# Altium schematic sheet Controller-Sheet-2.SchDoc
size 420 x 297 mm; SheetNumber: 4; SheetTotal: 7
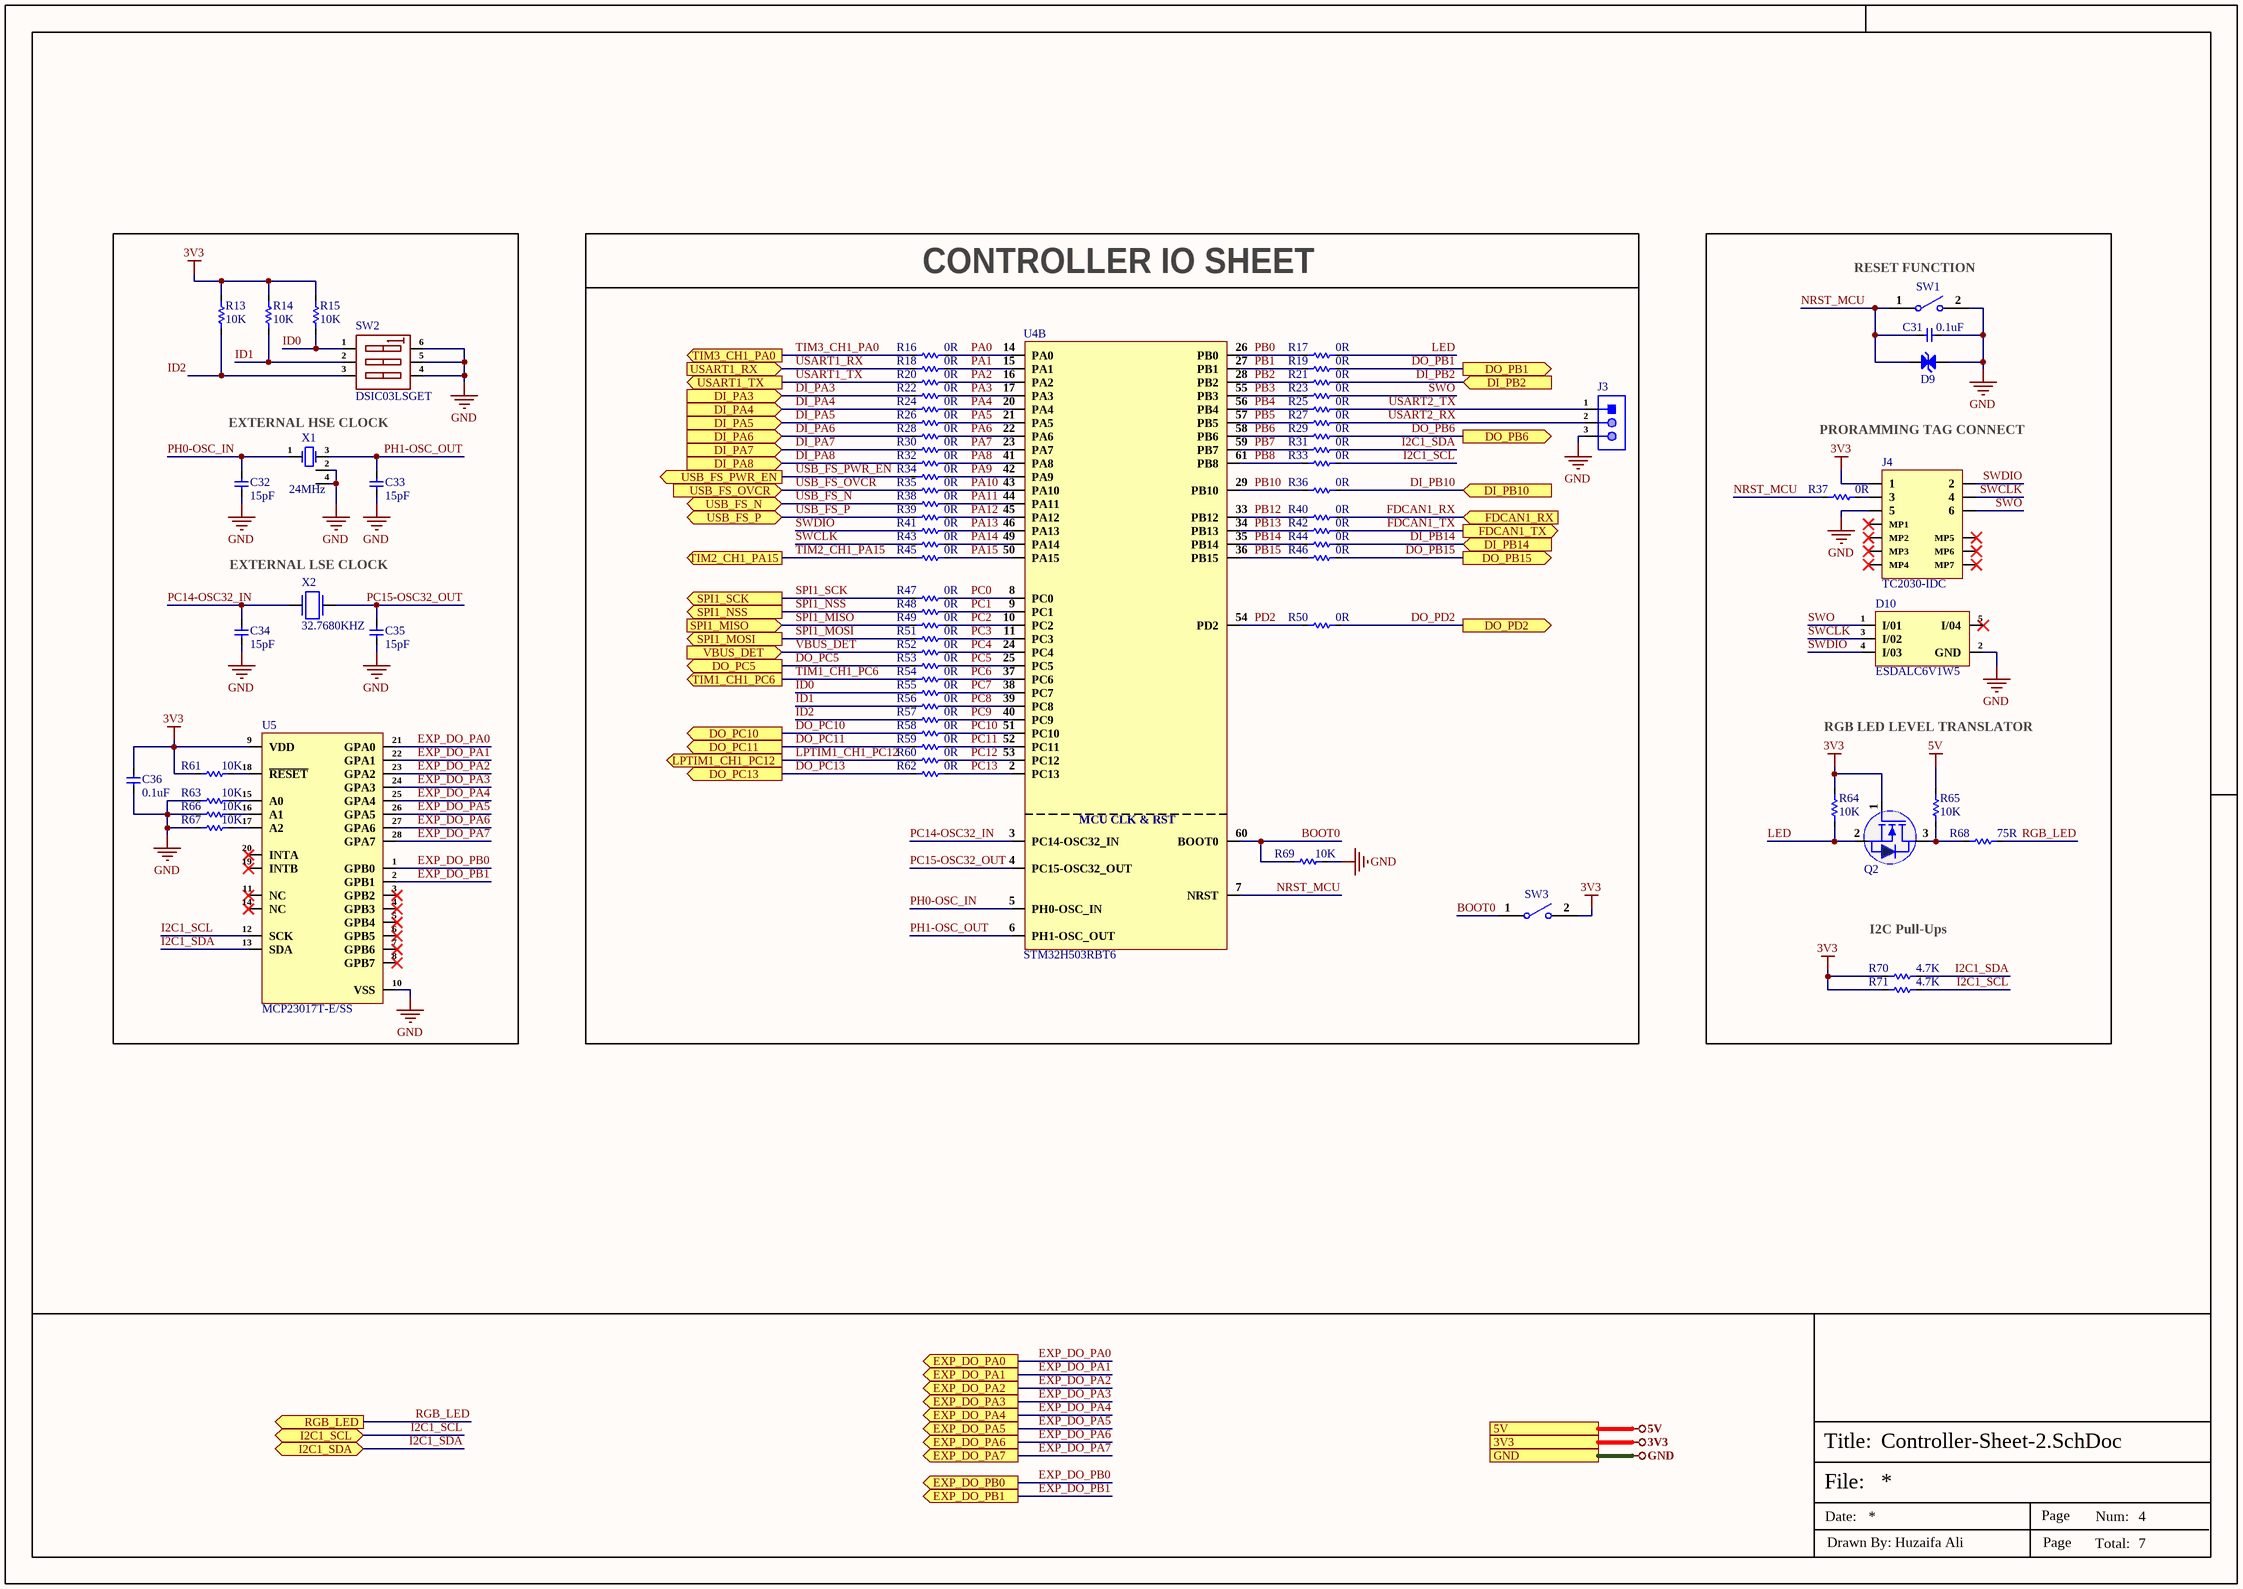
[diagram p0: Controller-Sheet-2.SchDoc]

## Parts
C31  0.1uF  [Cap-0402]
C32  15pF  [Cap-0201]
C33  15pF  [Cap-0201]
C34  15pF  [Cap-0201]
C35  15pF  [Cap-0201]
C36  0.1uF  [Cap-0402]
D9  ESDM2033MX4T5G  [DFN-2(0.3x0.6)]  (value not drawn)
D10  ESDALC6V1W5  [SOT-323-5]
J3  X6511WV-03H-C60D30  [HDR1X3_]  (value not drawn)
J4  TC2030-IDC  [TC2030-IDC_]
Q2  Si2302CDS  [Sot-23]  (value not drawn)
R13  10K  [Res-0402]
R14  10K  [Res-0402]
R15  10K  [Res-0402]
R16  0R  [Res-0402]
R17  0R  [Res-0402]
R18  0R  [Res-0402]
R19  0R  [Res-0402]
R20  0R  [Res-0402]
R21  0R  [Res-0402]
R22  0R  [Res-0402]
R23  0R  [Res-0402]
R24  0R  [Res-0402]
R25  0R  [Res-0402]
R26  0R  [Res-0402]
R27  0R  [Res-0402]
R28  0R  [Res-0402]
R29  0R  [Res-0402]
R30  0R  [Res-0402]
R31  0R  [Res-0402]
R32  0R  [Res-0402]
R33  0R  [Res-0402]
R34  0R  [Res-0402]
R35  0R  [Res-0402]
R36  0R  [Res-0402]
R37  0R  [Res-0402]
R38  0R  [Res-0402]
R39  0R  [Res-0402]
R40  0R  [Res-0402]
R41  0R  [Res-0402]
R42  0R  [Res-0402]
R43  0R  [Res-0402]
R44  0R  [Res-0402]
R45  0R  [Res-0402]
R46  0R  [Res-0402]
R47  0R  [Res-0402]
R48  0R  [Res-0402]
R49  0R  [Res-0402]
R50  0R  [Res-0402]
R51  0R  [Res-0402]
R52  0R  [Res-0402]
R53  0R  [Res-0402]
R54  0R  [Res-0402]
R55  0R  [Res-0402]
R56  0R  [Res-0402]
R57  0R  [Res-0402]
R58  0R  [Res-0402]
R59  0R  [Res-0402]
R60  0R  [Res-0402]
R61  10K  [Res-0402]
R62  0R  [Res-0402]
R63  10K  [Res-0402]
R64  10K  [Res-0402]
R65  10K  [Res-0402]
R66  10K  [Res-0402]
R67  10K  [Res-0402]
R68  75R  [Res-0402]
R69  10K  [Res-0402]
R70  4.7K  [Res-0402]
R71  4.7K  [Res-0402]
SW1  B3U-1000P  [B3U-1000P]  (value not drawn)
SW2  DSIC03LSGET  [DSIC03LSGET]
SW3  B3U-1000P  [B3U-1000P]  (value not drawn)
U4  STM32H503RBT6  [64-LQFP (10x10)]  (part B of 2)
U5  MCP23017T-E/SS  [SSOP-28-208mil]
X1  24MHz  [SMD2016-4P]
X2  32.7680KHZ  [NX3215SA-32.768K-STD-MUA-8_]

## Blocks framed on the sheet
CONTROLLER IO SHEET: J3 R16-R36 R38-R60 R62 R69 SW3 U4

## Ports
3V3 (see Top-Sheet[3B], Comms-Sheet[4D], Controller-Sheet-1[4D], Power-Sheet[4D], Stepper-Driver-Sheet[5D], USB-Sheet[4D]), 5V (see Top-Sheet[3B], Comms-Sheet[4D], Power-Sheet[4D], USB-Sheet[4D]), DI_PA3 (in, see Top-Sheet[3B]), DI_PA4 (in, see Top-Sheet[3B]), DI_PA5 (in, see Top-Sheet[3B]), DI_PA6 (in, see Top-Sheet[3B]), DI_PA7 (in, see Top-Sheet[3B]), DI_PA8 (in, see Top-Sheet[3B]), DI_PB2 (in, see Top-Sheet[3B]), DI_PB10 (in, see Top-Sheet[3B]), DI_PB14 (in, see Top-Sheet[3B]), DO_PB1 (out, see Top-Sheet[4B]), DO_PB6 (out, see Top-Sheet[3C]), DO_PB15 (out, see Top-Sheet[3C]), DO_PC5 (out, see Top-Sheet[3C]), DO_PC10 (out, see Top-Sheet[3B]), DO_PC11 (out, see Top-Sheet[3B]), DO_PC13 (out, see Top-Sheet[3B]), DO_PD2 (out, see Top-Sheet[3C]), EXP_DO_PA0 (out, see Top-Sheet[3C]), EXP_DO_PA1 (out, see Top-Sheet[3C]), EXP_DO_PA2 (out, see Top-Sheet[3C]), EXP_DO_PA3 (out, see Top-Sheet[3C]), EXP_DO_PA4 (out, see Top-Sheet[3C]), EXP_DO_PA5 (out, see Top-Sheet[3C]), EXP_DO_PA6 (out, see Top-Sheet[3C]), EXP_DO_PA7 (out, see Top-Sheet[3C]), EXP_DO_PB0 (out, see Top-Sheet[4B]), EXP_DO_PB1 (out, see Top-Sheet[4B]), FDCAN1_RX (in, see Top-Sheet[4B]), FDCAN1_TX (out, see Top-Sheet[4B]), GND (see Top-Sheet[3B], Comms-Sheet[4D], Controller-Sheet-1[4D], Power-Sheet[4D], Stepper-Driver-Sheet[5D], USB-Sheet[4D]), I2C1_SCL (bidir, see Top-Sheet[3B]), I2C1_SDA (bidir, see Top-Sheet[3B]), LPTIM1_CH1_PC12 (out, see Top-Sheet[3C]), RGB_LED (out, see Top-Sheet[4B]), SPI1_MISO (in, see Top-Sheet[3B]), SPI1_MOSI (out, see Top-Sheet[3B]), SPI1_NSS (out, see Top-Sheet[3B]), SPI1_SCK (out, see Top-Sheet[3B]), TIM1_CH1_PC6 (out, see Top-Sheet[3B]), TIM2_CH1_PA15 (out, see Top-Sheet[3B]), TIM3_CH1_PA0 (out, see Top-Sheet[3C]), USART1_RX (in, see Top-Sheet[4B]), USART1_TX (out, see Top-Sheet[4B]), USB_FS_N (bidir, see Top-Sheet[4B], USB-Sheet[5B]), USB_FS_OVCR (in, see Top-Sheet[4B], USB-Sheet[1D]), USB_FS_P (bidir, see Top-Sheet[4B], USB-Sheet[5B]), USB_FS_PWR_EN (out, see Top-Sheet[4B], USB-Sheet[1D]), VBUS_DET (in, see Top-Sheet[4B], USB-Sheet[4B])

## Nets
3V3: C36.1 J4.1 Q2.1(G) R13.2 R14.2 R15.2 R61.2 R64.2 R70.1 R71.1 SW3.2 U5.9(VDD) ; port 3V3
5V: R65.2 ; port 5V
GND: C31.1 C32.1 C33.1 C34.1 C35.1 C36.2 D9.1(A) D10.2(GND) J3.3 J4.5 R63.2 R66.2 R67.2 R69.1 SW1.2 SW2.4(B3) SW2.5(B2) SW2.6(B1) U5.10(VSS) X1.2(GND) X1.4(GND) ; port GND
BOOT0: R69.2 SW3.1 U4.60(BOOT0)
DI_PA3: R22.2 ; port DI_PA3
DI_PA4: R24.2 ; port DI_PA4
DI_PA5: R26.2 ; port DI_PA5
DI_PA6: R28.2 ; port DI_PA6
DI_PA7: R30.2 ; port DI_PA7
DI_PA8: R32.2 ; port DI_PA8
DI_PB2: R21.1 ; port DI_PB2
DI_PB10: R36.1 ; port DI_PB10
DI_PB14: R44.1 ; port DI_PB14
DO_PB1: R19.1 ; port DO_PB1
DO_PB6: R29.1 ; port DO_PB6
DO_PB15: R46.1 ; port DO_PB15
DO_PC5: R53.2 ; port DO_PC5
DO_PC10: R58.2 ; port DO_PC10
DO_PC11: R59.2 ; port DO_PC11
DO_PC13: R62.2 ; port DO_PC13
DO_PD2: R50.1 ; port DO_PD2
EXP_DO_PA0: U5.21(GPA0) ; port EXP_DO_PA0
EXP_DO_PA1: U5.22(GPA1) ; port EXP_DO_PA1
EXP_DO_PA2: U5.23(GPA2) ; port EXP_DO_PA2
EXP_DO_PA3: U5.24(GPA3) ; port EXP_DO_PA3
EXP_DO_PA4: U5.25(GPA4) ; port EXP_DO_PA4
EXP_DO_PA5: U5.26(GPA5) ; port EXP_DO_PA5
EXP_DO_PA6: U5.27(GPA6) ; port EXP_DO_PA6
EXP_DO_PA7: U5.28(GPA7) ; port EXP_DO_PA7
EXP_DO_PB0: U5.1(GPB0) ; port EXP_DO_PB0
EXP_DO_PB1: U5.2(GPB1) ; port EXP_DO_PB1
FDCAN1_RX: R40.1 ; port FDCAN1_RX
FDCAN1_TX: R42.1 ; port FDCAN1_TX
I2C1_SCL: R33.1 R71.2 U5.12(SCK) ; port I2C1_SCL
I2C1_SDA: R31.1 R70.2 U5.13(SDA) ; port I2C1_SDA
ID0: R15.1 R55.2 SW2.1(A1)
ID1: R14.1 R56.2 SW2.2(A2)
ID2: R13.1 R57.2 SW2.3(A3)
LED: Q2.2(S) R17.1 R64.1
LPTIM1_CH1_PC12: R60.2 ; port LPTIM1_CH1_PC12
NRST_MCU: C31.2 D9.2(A) R37.2 SW1.1 U4.7(NRST)
PA0: R16.1 U4.14(PA0)
PA1: R18.1 U4.15(PA1)
PA2: R20.1 U4.16(PA2)
PA3: R22.1 U4.17(PA3)
PA4: R24.1 U4.20(PA4)
PA5: R26.1 U4.21(PA5)
PA6: R28.1 U4.22(PA6)
PA7: R30.1 U4.23(PA7)
PA8: R32.1 U4.41(PA8)
PA9: R34.1 U4.42(PA9)
PA10: R35.1 U4.43(PA10)
PA11: R38.1 U4.44(PA11)
PA12: R39.1 U4.45(PA12)
PA13: R41.1 U4.46(PA13)
PA14: R43.1 U4.49(PA14)
PA15: R45.1 U4.50(PA15)
PB0: R17.2 U4.26(PB0)
PB1: R19.2 U4.27(PB1)
PB2: R21.2 U4.28(PB2)
PB3: R23.2 U4.55(PB3)
PB4: R25.2 U4.56(PB4)
PB5: R27.2 U4.57(PB5)
PB6: R29.2 U4.58(PB6)
PB7: R31.2 U4.59(PB7)
PB8: R33.2 U4.61(PB8)
PB10: R36.2 U4.29(PB10)
PB12: R40.2 U4.33(PB12)
PB13: R42.2 U4.34(PB13)
PB14: R44.2 U4.35(PB14)
PB15: R46.2 U4.36(PB15)
PC0: R47.1 U4.8(PC0)
PC1: R48.1 U4.9(PC1)
PC2: R49.1 U4.10(PC2)
PC3: R51.1 U4.11(PC3)
PC4: R52.1 U4.24(PC4)
PC5: R53.1 U4.25(PC5)
PC6: R54.1 U4.37(PC6)
PC7: R55.1 U4.38(PC7)
PC8: R56.1 U4.39(PC8)
PC9: R57.1 U4.40(PC9)
PC10: R58.1 U4.51(PC10)
PC11: R59.1 U4.52(PC11)
PC12: R60.1 U4.53(PC12)
PC13: R62.1 U4.2(PC13)
PC14-OSC32_IN: C34.2 U4.3(PC14-OSC32_IN) X2.2
PC15-OSC32_OUT: C35.2 U4.4(PC15-OSC32_OUT) X2.1
PD2: R50.2 U4.54(PD2)
PH0-OSC_IN: C32.2 U4.5(PH0-OSC_IN) X1.1(OSC1)
PH1-OSC_OUT: C33.2 U4.6(PH1-OSC_OUT) X1.3(OSC2)
RGB_LED: R68.2 ; port RGB_LED
SPI1_MISO: R49.2 ; port SPI1_MISO
SPI1_MOSI: R51.2 ; port SPI1_MOSI
SPI1_NSS: R48.2 ; port SPI1_NSS
SPI1_SCK: R47.2 ; port SPI1_SCK
SWCLK: D10.3(I/02) J4.4 R43.2
SWDIO: D10.4(I/03) J4.2 R41.2
SWO: D10.1(I/01) J4.6 R23.1
TIM1_CH1_PC6: R54.2 ; port TIM1_CH1_PC6
TIM2_CH1_PA15: R45.2 ; port TIM2_CH1_PA15
TIM3_CH1_PA0: R16.2 ; port TIM3_CH1_PA0
USART1_RX: R18.2 ; port USART1_RX
USART1_TX: R20.2 ; port USART1_TX
USART2_RX: J3.2 R27.1
USART2_TX: J3.1 R25.1
USB_FS_N: R38.2 ; port USB_FS_N
USB_FS_OVCR: R35.2 ; port USB_FS_OVCR
USB_FS_P: R39.2 ; port USB_FS_P
USB_FS_PWR_EN: R34.2 ; port USB_FS_PWR_EN
VBUS_DET: R52.2 ; port VBUS_DET
NetJ4_3: J4.3 R37.1
NetQ2_3: Q2.3(D) R65.1 R68.1
NetR61_1: R61.1 U5.18(~{RESET})
NetR63_1: R63.1 U5.15(A0)
NetR66_1: R66.1 U5.16(A1)
NetR67_1: R67.1 U5.17(A2)

Not connected (* = marked no-connect by the designer): D10 5(I/04)*; J4 MP1* MP2* MP3* MP4* MP5* MP6* MP7*; U5 3(GPB2)* 4(GPB3)* 5(GPB4)* 6(GPB5)* 7(GPB6)* 8(GPB7)* 11(NC)* 14(NC)* 19(INTB)* 20(INTA)*

## Notes on the sheet
- (near SW1) RESET FUNCTION
- EXTERNAL HSE CLOCK
- PRORAMMING TAG CONNECT
- (near X2) EXTERNAL LSE CLOCK
- RGB LED LEVEL TRANSLATOR
- I2C Pull-Ups
- File:
- Title:
- Date:
- Page
- Num:
- Total:
- Drawn By: Huzaifa Ali
- (in symbol STM32H503RBT6, part B) MCU CLK & RST

## Library data of the parts
C31 C36 = CC0402JRX7R7BB104: CAP CER 0.1UF 16V X7R 0402; Manufacturer: Yageo; Material: 4241ConductorMaterial; Value: 100nF; Tolerance: 5%; Item Type: Capacitor; Supplier: Digikey; Supplier Part Number: 311-1676-1-ND; Manufacturer Part Number: CC0402JRX7R7BB104; RoHS: Yes; Category: Ceramic Capacitors; Stock: 1659111; Pricing: 1=0.1, 10=0.046, 50=0.0262, 100=0.0203, 500=0.01528, 1000=0.012, 2500=0.01091, 5000=0.01004 (USD); Mounting Technology: Surface Mount; Case/Package: 0402; Case Code (Metric): 1005; Case Code (Imperial): 0402; Min Operating Temperature: -55°C; Max Operating Temperature: 125°C; Dielectric: X7R; Packaging: Tape and Reel; Package Quantity: 10000; Voltage Rating (DC): 16V; Voltage Rating: 16V; Series: CC; Construction: Flat; Length: 0.039inch; Width: 0.02inch; Height: 0.5mm; Thickness: 0.022inch; Lead Free: Lead Free; Halogen Free: Halogen Free; RoHS Compliant: Yes; ComponentLink1URL: https://datasheet.ciiva.com/13210/upy-gphc-x7r-6-3v-to-50v-8-12304-13210152.pdf?src-supplier=Mouser; ComponentLink1Description: https://datasheet.ciiva.com/13210/upy-gphc-x7r-6-3v-to-50v-8-12304-13210152.pdf?src-supplier=Mouser; LCSC Part Number: C541464
C32-C35 = CC0201JRNPO9BN150: CAP CER 15PF 50V C0G/NPO 0201; Manufacturer: Yageo; Item Type: Capacitor; Supplier: Future Electronics; Supplier Part Number: 2580314; Manufacturer Part Number: CC0201JRNPO9BN150; RoHS: Yes; Category: Ceramic Capacitors; Stock: 585000; Pricing: 15000=0.0012, 60000=0.0011, 225000=0.0011, 600000=0.001, 1500000=0.001 (USD); ComponentLink1URL: https://datasheet.ciiva.com/176/mlccorderingcode-176501.pdf?src-supplier=Digi-Key; ComponentLink1Description: https://datasheet.ciiva.com/176/mlccorderingcode-176501.pdf?src-supplier=Digi-Key; ComponentLink2URL: https://datasheet.ciiva.com/176/mlccorderingcode-176502.pdf?src-supplier=Digi-Key; ComponentLink2Description: https://datasheet.ciiva.com/176/mlccorderingcode-176502.pdf?src-supplier=Digi-Key; ComponentLink3URL: https://datasheet.ciiva.com/176/mlccorderingcode-176503.pdf?src-supplier=Digi-Key; ComponentLink3Description: https://datasheet.ciiva.com/176/mlccorderingcode-176503.pdf?src-supplier=Digi-Key; ComponentLink4URL: https://datasheet.ciiva.com/17205/upy-gp-np0-16v-to-50v-8-17205625.pdf?src-supplier=Future+Electronics; ComponentLink4Description: https://datasheet.ciiva.com/17205/upy-gp-np0-16v-to-50v-8-17205625.pdf?src-supplier=Future+Electronics; LCSC Part Number: C277480
D9 = ESDM2033MX4T5G: DIODE BIDIR ESD X4DFN2; Manufacturer: ON Semiconductor; Item Type: (TVS/ESD); Supplier: Avnet; LCSC Part Number: C896720; Manufacturer Part Number: ESDM2033MX4T5G; RoHS: Yes; Stock: 629400; Pricing: 8961=0.04129, 9000=0.04018, 18000=0.03906, 45000=0.03794, 90000=0.03683, 450000=0.03571, 900000=0.0346 (USD); Series: -
D10 = ESDALC6V1W5: TVS DIODE 3VWM SOT323-5; Manufacturer: STMicroelectronics; Item Type: TVS Diodes; Supplier: Future Electronics; LCSC Part Number: C703691; Manufacturer Part Number: ESDALC6V1W5; RoHS: Yes; Stock: 3000; Pricing: 3000=0.0569, 9000=0.0547, 12000=0.0774, 15000=0.0538, 30000=0.0749, 45000=0.0518, 75000=0.05 (USD); ComponentLink1URL: https://datasheet.ciiva.com/23847/cd00002946-23847220.pdf?src-supplier=Newark; ComponentLink1Description: https://datasheet.ciiva.com/23847/cd00002946-23847220.pdf?src-supplier=Newark; ComponentLink2URL: https://datasheet.ciiva.com/4509/cd00002946-81943-4509940.pdf?src-supplier=Mouser; ComponentLink2Description: https://datasheet.ciiva.com/4509/cd00002946-81943-4509940.pdf?src-supplier=Mouser; ComponentLink3URL: https://datasheet.ciiva.com/5782/cd00002946-5782886.pdf?src-supplier=Farnell; ComponentLink3Description: https://datasheet.ciiva.com/5782/cd00002946-5782886.pdf?src-supplier=Farnell; ComponentLink4URL: https://datasheet.ciiva.com/338/cd00002946-338376.pdf?src-supplier=Digikey; ComponentLink4Description: https://datasheet.ciiva.com/338/cd00002946-338376.pdf?src-supplier=Digikey; ComponentLink5URL: https://datasheet.ciiva.com/338/cd00002946-338377.pdf?src-supplier=Digikey; ComponentLink5Description: https://datasheet.ciiva.com/338/cd00002946-338377.pdf?src-supplier=Digikey; ComponentLink6URL: https://datasheet.ciiva.com/338/cd00002946-338378.pdf?src-supplier=Digikey; ComponentLink6Description: https://datasheet.ciiva.com/338/cd00002946-338378.pdf?src-supplier=Digikey
J3 = X6511WV-03H-C60D30: Gold 250V 3A Straight Square Pins 2.5mm 3P 260℃ 6mm -40℃~+105℃ 3mm 2.54mm Plugin Black Brass 1x3P Plugin,P=2.54mm Pin Headers ROHS; Manufacturer: XKB; Item Type: Male Header; Manufacturer Part Number: X6511WV-03H-C60D30; Package: Plugin,P=2.54mm; LCSC Part Number: C706875; ComponentLink1Description: LCSC; ComponentLink1URL: https://www.lcsc.com/product-detail/Pin-Headers_XKB-Connectivity-X6511WV-03H-C60D30_C706875.html
J4 = TC2030-IDC: CABLE ADAPTER 6 POS; Manufacturer: Tag-Connect; ComponentLink1URL: http://www.tag-connect.com/Materials/TC2030-MCP%20Datasheet.pdf?src-supplier=Digi-Key; ComponentLink1Description: http://www.tag-connect.com/Materials/TC2030-MCP%20Datasheet.pdf?src-supplier=Digi-Key; Supplier 1: Digi-Key; Manufacturer Part Number: TC2030-IDC; Stock 1: 284; Pricing 1: 1=43.71 (USD); Package Quantity: 1; Supplier Part Number 1: TC2030-IDC-ND
Q2 = Si2302CDS: N-CHANNEL 20-V (D-S) MOSFET; Manufacturer: TECH PUBLIC; ComponentLink1Description: LCSC; ComponentLink1URL: https://www.lcsc.com/product-detail/MOSFETs_TECH-PUBLIC-SI2302CDS_C5310968.html; Manufacturer Part Number: SI2302CDS; Package: SOT-23; LCSC Part Number: C5310968; Item Type: Mosfet
R13-R15 R61 R63-R67 R69 = RC0402FR-0710KL: RES 10K OHM 1% 1/16W 0402; Manufacturer: Yageo; Resistance: 10kR; Voltage Rating (DC): 50V; Temperature Coefficient: 100ppm/°C; Power Rating: 62.5mW; Max Power Dissipation: 63mW; Item Type: Resistor; Supplier 1: Mouser; Manufacturer Part Number: RC0402FR-0710KL; RoHS: Yes; Category: Chip SMD Resistors; Stock 1: 18648329; Pricing 1: 1=0.10000, 10=0.01400, 50=0.01400, 100=0.00500, 1000=0.00300, 10000=0.00200 (USD); Case/Package: 0402; Number of Pins: 2; Case Code (Imperial): 0402; Case Code (Metric): 1005; Min Operating Temperature: -55°C; Max Operating Temperature: 155°C; Resistor Type: Thick Film; Tolerance: 1%; Packaging: Tape and Reel; Voltage Rating: 50V; Termination: SMD/SMT; Working Voltage: 50V; Number of Terminations: 2; Features: Moisture Resistant; Series: RC; Resistance Tolerance: 1%; Construction: Rectangular; Length: 1mm; Width: 0.5mm; Height: 0.32mm; Depth: 0.5mm; Lead Pitch: 0.2mm; REACH SVHC: No SVHC; Lead Free: Lead Free; RoHS Compliant: Yes; Military Standard: Not; ComponentLink1URL: https://datasheet.ciiva.com/7660/38568-7660787.pdf?src-supplier=Element14; ComponentLink1Description: https://datasheet.ciiva.com/7660/38568-7660787.pdf?src-supplier=Element14; ComponentLink2URL: https://datasheet.ciiva.com/7849/1686128-7849814.pdf?src-supplier=Element14; ComponentLink2Description: https://datasheet.ciiva.com/7849/1686128-7849814.pdf?src-supplier=Element14; ComponentLink3URL: https://datasheet.ciiva.com/7983/1018594-7983486.pdf?src-supplier=Element14; ComponentLink3Description: https://datasheet.ciiva.com/7983/1018594-7983486.pdf?src-supplier=Element14; ComponentLink4URL: https://datasheet.ciiva.com/22747/1018594-22747512.pdf?src-supplier=Element14; ComponentLink4Description: https://datasheet.ciiva.com/22747/1018594-22747512.pdf?src-supplier=Element14; ComponentLink5URL: https://datasheet.ciiva.com/12667/pyu-rc0402-51-rohs-l-6-r-12667067.pdf?src-supplier=Mouser; ComponentLink5Description: https://datasheet.ciiva.com/12667/pyu-rc0402-51-rohs-l-6-r-12667067.pdf?src-supplier=Mouser; ComponentLink6URL: https://datasheet.ciiva.com/7849/1784430-7849813.pdf?src-supplier=Element14; ComponentLink6Description: https://datasheet.ciiva.com/7849/1784430-7849813.pdf?src-supplier=Element14; ComponentLink7URL: https://datasheet.ciiva.com/7849/1784430-7849815.pdf?src-supplier=Element14; ComponentLink7Description: https://datasheet.ciiva.com/7849/1784430-7849815.pdf?src-supplier=Element14; Supplier Part Number 1: 603-RC0402FR-0710KL; LCSC Part Number: C60490
R16-R60 R62 = RC0402FR-070RL: RES 0 OHM JUMPER 1/16W 0402; Manufacturer: Yageo; Item Type: Resistors; Tolerance: 1%; Power Rating: 62.5mW; Voltage Rating: 50V; Temperature Coefficient: 200ppm/°C; Max Power Dissipation: 63mW; Supplier 1: Mouser; Manufacturer Part Number: RC0402FR-070RL; RoHS: Yes; Stock 1: 8556842; Pricing 1: 1=0.10000, 10=0.01400, 50=0.01400, 100=0.00600, 1000=0.00300, 5000=0.00200, 10000=0.00100 (USD); Mount: Surface Mount; Case/Package: 0402; Contact Plating: Tin,Matte; Case Code (Imperial): 0402; Case Code (Metric): 1005; Size Code: 0402; Min Operating Temperature: -55°C; Max Operating Temperature: 155°C; Resistance: 0R; Resistor Type: Thick Film; Packaging: Tape and Reel; Termination: SMD/SMT; Features: Moisture Resistant; Series: RC; Number of Terminations: 2; Length: 1mm; Width: 0.5mm; Height: 0.35mm; Radiation Hardening: No; Lead Free: Lead Free; RoHS Compliant: Yes; ComponentLink1URL: https://datasheet.ciiva.com/8896/pyu-rc0402-51-rohs-l-6-8896149.pdf?src-supplier=Avnet; ComponentLink1Description: https://datasheet.ciiva.com/8896/pyu-rc0402-51-rohs-l-6-8896149.pdf?src-supplier=Avnet; ComponentLink2URL: https://datasheet.ciiva.com/16790/pyu-rc0402-51-rohs-l-6-r-16790444.pdf?src-supplier=Future+Electronics; ComponentLink2Description: https://datasheet.ciiva.com/16790/pyu-rc0402-51-rohs-l-6-r-16790444.pdf?src-supplier=Future+Electronics; Supplier Part Number 1: 603-RC0402FR-070RL; LCSC Part Number: C106231
R68 = RC0402JR-0775RL: RES 75 OHM 5% 1/16W 0402; Manufacturer: Yageo; Item Type: Resistor; Temperature Coefficient: 100ppm/°C; Power Rating: 62.5mW; Voltage Rating: 50V; Max Power Dissipation: 63mW; Supplier: Digikey; Supplier Part Number: 311-75JRCT-ND; Manufacturer Part Number: RC0402JR-0775RL; RoHS: Yes; Stock: 2993323; Pricing: 1=0.1, 10=0.018, 50=0.0102, 100=0.0083, 500=0.00528, 1000=0.00444, 5000=0.00307 (USD); Case/Package: 0402; Pins: 2; Contact Plating: Tin,Lead; Case Code (Imperial): 0402; Case Code (Metric): 1005; Min Operating Temperature: -55°C; Max Operating Temperature: 155°C; Value: 75R; Tolerance: 5%; Resistor Type: Thick Film; Packaging: Tape and Reel; Termination: SMD/SMT; Voltage Rating (DC): 50V; Features: Moisture Resistant; Series: RC; Number of Terminations: 2; Resistance Tolerance: 5%; Length: 1mm; Width: 0.5mm; Height: 0.35mm; Reach SVHC Compliant: No; Lead Free: Lead Free; RoHS Compliant: Yes; ComponentLink1URL: https://datasheet.ciiva.com/7983/1018594-7983612.pdf?src-supplier=Element14; ComponentLink1Description: https://datasheet.ciiva.com/7983/1018594-7983612.pdf?src-supplier=Element14; ComponentLink2URL: https://datasheet.ciiva.com/17082/pyu-rc0402-51-rohs-l-6-r-17082239.pdf?src-supplier=Future+Electronics; ComponentLink2Description: https://datasheet.ciiva.com/17082/pyu-rc0402-51-rohs-l-6-r-17082239.pdf?src-supplier=Future+Electronics; LCSC Part Number: C137841
R70 R71 = RC0402FR-074K7L: RES 4.7K OHM 1% 1/16W 0402; Manufacturer: Yageo; Voltage Rating (DC): 50V; Power Rating: 62.5mW; Resistance: 4.7kR; Temperature Coefficient: 100ppm/°C; Max Power Dissipation: 63mW; Item Type: Resistor; Supplier 1: Avnet; Manufacturer Part Number: RC0402FR-074K7L; RoHS: Yes; Category: Chip SMD Resistors; Stock 1: 2420000; Pricing 1: 10000=0.00085 (USD); Case/Package: 0402; Number of Pins: 2; Case Code (Imperial): 0402; Case Code (Metric): 1005; Size Code: 0402; Min Operating Temperature: -55°C; Max Operating Temperature: 155°C; Tolerance: 1%; Voltage Rating: 50V; Packaging: Tape and Reel; Resistor Type: Thick Film; Termination: SMD/SMT; Features: Moisture Resistant; Series: RC; Number of Terminations: 2; Resistance Tolerance: 1%; Construction: Rectangular; Length: 1mm; Width: 0.5mm; Height: 0.32mm; Depth: 0.5mm; Height - Seated (Max): 0.016inch; RoHS Compliant: Yes; Reach SVHC Compliant: Yes; Military Standard: Not; Lead Free: Lead Free; ComponentLink1URL: https://datasheet.ciiva.com/22661/1686128-22661342.pdf?src-supplier=Element14; ComponentLink1Description: https://datasheet.ciiva.com/22661/1686128-22661342.pdf?src-supplier=Element14; ComponentLink2URL: https://datasheet.ciiva.com/7850/1018594-7850022.pdf?src-supplier=Element14; ComponentLink2Description: https://datasheet.ciiva.com/7850/1018594-7850022.pdf?src-supplier=Element14; ComponentLink3URL: https://datasheet.ciiva.com/7850/1018594-7850023.pdf?src-supplier=Element14; ComponentLink3Description: https://datasheet.ciiva.com/7850/1018594-7850023.pdf?src-supplier=Element14; ComponentLink4URL: https://datasheet.ciiva.com/15215/getdatasheetpartid-328119-15215035.pdf?src-supplier=Verical; ComponentLink4Description: https://datasheet.ciiva.com/15215/getdatasheetpartid-328119-15215035.pdf?src-supplier=Verical; Supplier Part Number 1: RC0402FR-074K7L; LCSC Part Number: C105871
SW1 SW3 = B3U-1000P: SWITCH TACTILE SPST-NO 0.05A 12V; Manufacturer: Omron; Mechanical Life: 200000Cycles; Operating Force: 1.5N; Throw Configuration: SPST; Current Rating: 50mA; Contact Resistance: 100mR; Illumination Type: Non-Illuminated,Illuminated; Switch Travel: 0.15mm; Switch Function: Off-Mom; Actuator Type: Standard; Actuator Length: 0.4mm; Ratings: Dust Proof,IP40; ComponentLink1URL: http://www.farnell.com/datasheets/60838.pdf?src-supplier=Farnell; ComponentLink1Description: http://www.farnell.com/datasheets/60838.pdf?src-supplier=Farnell; ComponentLink2URL: http://www.farnell.com/datasheets/60838.pdf?src-supplier=Element14; ComponentLink2Description: http://www.farnell.com/datasheets/60838.pdf?src-supplier=Element14; ComponentLink3URL: https://omronfs.omron.com/en_US/ecb/products/pdf/en-b3u.pdf?src-supplier=Digi-Key; ComponentLink3Description: https://omronfs.omron.com/en_US/ecb/products/pdf/en-b3u.pdf?src-supplier=Digi-Key; ComponentLink4URL: http://www.omron.com/ecb/products/pdf/en-b3u.pdf?src-supplier=Digi-Key; ComponentLink4Description: http://www.omron.com/ecb/products/pdf/en-b3u.pdf?src-supplier=Digi-Key; ComponentLink5URL: https://www.distrelec.biz/Web/Downloads/he/et/B3U_eng_datasheet.pdf?mime=application%2Fpdf&src-supplier=Distrelec; ComponentLink5Description: https://www.distrelec.biz/Web/Downloads/he/et/B3U_eng_datasheet.pdf?mime=application%2Fpdf&src-supplier=Distrelec; ComponentLink6URL: http://www.onlinecomponents.com/productFiles/mf-OM/en-b3u.pdf?src-supplier=Onlinecomponents.com; ComponentLink6Description: http://www.onlinecomponents.com/productFiles/mf-OM/en-b3u.pdf?src-supplier=Onlinecomponents.com; Supplier 1: Digi-Key; Manufacturer Part Number: B3U-1000P; Stock 1: 116454; Pricing 1: 1=1, 10=0.961, 25=0.9064, 50=0.7976, 100=0.7251, 250=0.68888, 500=0.67074, 1000=0.52571 (USD); Mount: Surface Mount; Weight: 0.000776oz; Contact Material: Silver; Min Operating Temperature: -25°C; Max Operating Temperature: 70°C; Packaging: Tape and Reel; Voltage Rating (DC): 12V; Package Quantity: 1; Max Current Rating: 50mA; Termination: SMD/SMT; Orientation: Straight; Max Voltage Rating (DC): 12V; Electrical Life: 200000Cycles; Insulation Resistance: 100MR; Contact Current Rating: 50mA; Length: 4mm; Height: 1.2mm; Depth: 2.5mm; Width: 3mm; REACH SVHC: Unknown; Lead Free: Lead Free; ComponentLink7URL: https://www.verical.com/server-webapp/html/getDatasheet?partID=552554&src-supplier=Verical; ComponentLink7Description: https://www.verical.com/server-webapp/html/getDatasheet?partID=552554&src-supplier=Verical; ComponentLink8URL: http://www.farnell.com/datasheets/1685550.pdf?src-supplier=Element14; ComponentLink8Description: http://www.farnell.com/datasheets/1685550.pdf?src-supplier=Element14; ComponentLink9URL: http://www.farnell.com/datasheets/2610940.pdf?src-supplier=Farnell; ComponentLink9Description: http://www.farnell.com/datasheets/2610940.pdf?src-supplier=Farnell; ComponentLink10URL: https://www.alliedelec.com/m/d/4c8a9ef82804fc3c241a13c1e298fd73.pdf?src-supplier=Allied+Electronics; ComponentLink10Description: https://www.alliedelec.com/m/d/4c8a9ef82804fc3c241a13c1e298fd73.pdf?src-supplier=Allied+Electronics; Supplier Part Number 1: SW1020DKR-ND; LCSC Part Number: C231329; Item Type: Switch
SW2 = DSIC03LSGET: 3 positions SPST Black Flat Toggle, Raised Style SMD-6P,6x7.6mm DIP Switches ROHS; Manufacturer: DongGuan KINGTEK Industrial Co.,LTD; Manufacturer Part Number: DSIC03LSGET; Package: SMD-6P,6x7.6mm; LCSC Part Number: C57453; Item Type: DIP Switches; ComponentLink1Description: LCSC; ComponentLink1URL: https://www.lcsc.com/product-detail/DIP-Switches_DongGuan-KINGTEK-Industrial-Co-LTD-DSIC03LSGET_C57453.html
U4 = STM32H503RBT6: IC MCU 32BIT 128KB FLASH 64LQFP; Manufacturer: STMicroelectronics; Supplier: Mouser; LCSC Part Number: C6807804; Manufacturer Part Number: STM32H503RBT6; RoHS: No; Item Type: IC; Stock: 991; Pricing: 1=3.75, 10=2.6, 50=2.6, 100=2.28, 1000=2.09, 10000=1.98 (USD)
U5 = MCP23017T-E/SS: IC XPNDR 1.7MHZ I2C 28SSOP; Manufacturer: Microchip; Operating Supply Voltage: 5.5V; Interface: I2C,Serial; Number of Channels: 1; Output Current: 25mA; Number of I/Os: 16; Power Dissipation: 700mW; Clock Frequency: 10MHz; Output Type: PUSH-PULL; Supply Current: 1mA; Supplier 1: Digi-Key; Manufacturer Part Number: MCP23017T-E/SS; RoHS: Yes; Category: Interface ICs; Stock 1: 26314; Pricing 1: 1=1.69, 25=1.4, 100=1.28 (USD); Mounting Technology: Surface Mount; Case/Package: SSOP; Pins: 28; Min Operating Temperature: -40°C; Max Operating Temperature: 125°C; Package Quantity: 2100; Series: -; Packaging: Tape and Reel; Frequency: 1.7MHz; Number of Bits: 16; Nominal Supply Voltage: 5.5V; Lead Free: Lead Free; RoHS Compliant: Yes; ComponentLink1URL: https://datasheet.ciiva.com/12267/21952b-12267583.pdf?src-supplier=Mouser; ComponentLink1Description: https://datasheet.ciiva.com/12267/21952b-12267583.pdf?src-supplier=Mouser; ComponentLink2URL: https://datasheet.ciiva.com/8128/21952b-8128586.pdf?src-supplier=Avnet; ComponentLink2Description: https://datasheet.ciiva.com/8128/21952b-8128586.pdf?src-supplier=Avnet; ComponentLink3URL: https://datasheet.ciiva.com/16454/filehandler-aspxddocname-en023709-16454267.pdf?src-supplier=Future+Electronics; ComponentLink3Description: https://datasheet.ciiva.com/16454/filehandler-aspxddocname-en023709-16454267.pdf?src-supplier=Future+Electronics; ComponentLink4URL: https://datasheet.ciiva.com/1780/21952b-1780738.pdf?src-supplier=Digi-Key; ComponentLink4Description: https://datasheet.ciiva.com/1780/21952b-1780738.pdf?src-supplier=Digi-Key; Supplier Part Number 1: MCP23017T-E/SSCT-ND; LCSC Part Number: C558584; Item Type: IC
X1 = XL7EL89COI-111YLC-24M: 24MHz Surface Mount Crystal 12pF ±10ppm ±20ppm SMD2016-4P Crystals ROHS; Manufacturer: YXC; Manufacturer Part Number: XL7EL89COI-111YLC-24M; Package: SMD2016-4; LCSC Part Number: C22434877; Item Type: Crystal; ComponentLink1Description: LCSC; ComponentLink1URL: https://www.lcsc.com/product-detail/Crystals_YXC-Crystal-Oscillators-XL7EL89COI-111YLC-24M_C22434877.html
X2 = NX3215SA-32.768K-STD-MUA-8: CRYSTAL 32.7680KHZ 12.5PF SMD; Manufacturer: NDK; Frequency: 32.768kHz; Frequency Tolerance: 20ppm; ESR (Equivalent Series Resistance): 70kR; Supplier 1: Digi-Key; Manufacturer Part Number: NX3215SA-32.768K-STD-MUA-8; Stock 1: 29951; Pricing 1: 1=0.68, 10=0.602, 50=0.5628, 100=0.4974, 500=0.47124, 1000=0.3927 (USD); Mount: Surface Mount; Case/Package: SMD/SMT; Number of Pins: 2; Min Operating Temperature: -40°C; Max Operating Temperature: 85°C; Package Quantity: 1000; Load Capacitance: 12.5pF; Packaging: Tape and Reel; Length: 0.126inch; Height: 0.035inch; Width: 0.059inch; Lead Free: Lead Free; ComponentLink1URL: https://media.digikey.com/pdf/Data%20Sheets/NDK%20PDFs/NX3215SA-32.768K-STD-MUA-8.pdf?src-supplier=Digi-Key; ComponentLink1Description: https://media.digikey.com/pdf/Data%20Sheets/NDK%20PDFs/NX3215SA-32.768K-STD-MUA-8.pdf?src-supplier=Digi-Key; ComponentLink2URL: http://www.ndk.com/images/products/catalog/c_NX3215SA-STD-MUA-14_e.pdf?src-supplier=Digi-Key; ComponentLink2Description: http://www.ndk.com/images/products/catalog/c_NX3215SA-STD-MUA-14_e.pdf?src-supplier=Digi-Key; Supplier Part Number 1: 644-1156-6-ND; LCSC Part Number: C156245